# Altium schematic sheet AltiumST32_Schematic.SchDoc
size A3; SheetNumber: 1; SheetTotal: 1
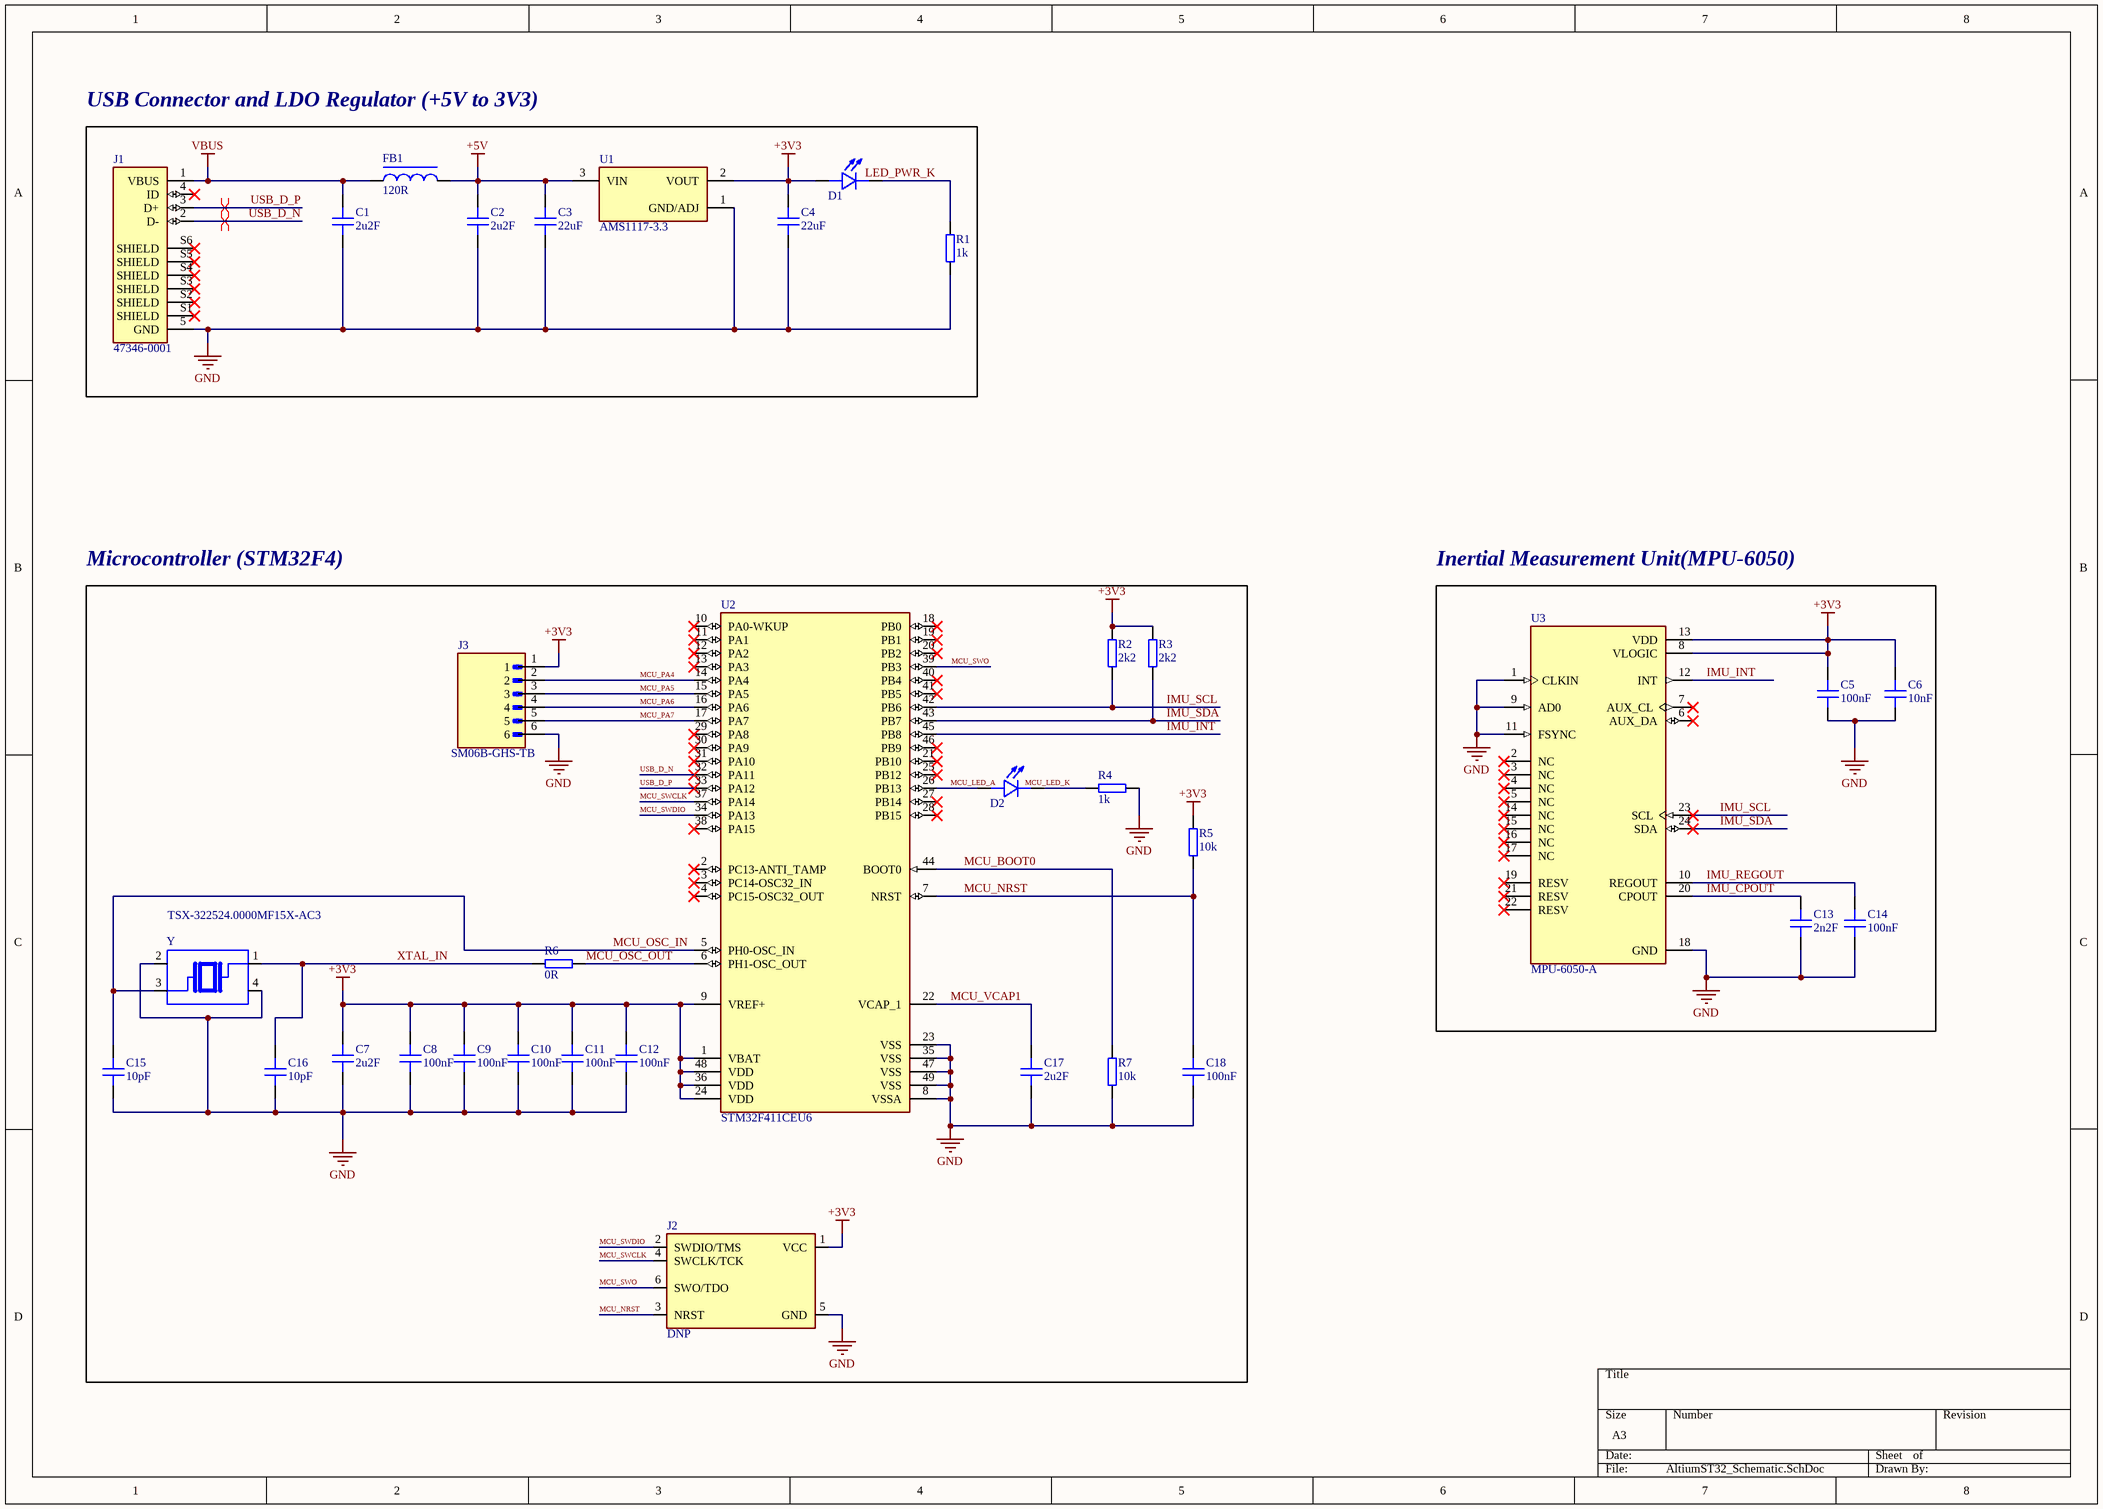
[diagram p0: AltiumST32_Schematic.SchDoc]

## Parts
C1  2u2F  [C0603]
C2  2u2F  [C0603]
C3  22uF  [C0805]
C4  22uF  [C0805]
C5  100nF  [C0402]
C6  10nF  [C0402]
C7  2u2F  [C0603]
C8  100nF  [C0402]
C9  100nF  [C0402]
C10  100nF  [C0402]
C11  100nF  [C0402]
C12  100nF  [C0402]
C13  2n2F  [C0402]
C14  100nF  [C0402]
C15  10pF  [C0402]
C16  10pF  [C0402]
C17  2u2F  [C0603]
C18  100nF  [C0402]
D1  SML-P11VTT86R  [LED_SML-P11VTT86R]  (value not drawn)
D2  SML-P11VTT86R  [LED_SML-P11VTT86R]  (value not drawn)
FB1  120R  [WE-CBF_0603_W2.6]
J1  47346-0001  [MOLEX_47346-0001]
J2  DNP  [TAG_TC2030-IDC-NL]
J3  SM06B-GHS-TB  [JST_SM06B-GHS-TB]
R1  1k  [R0402_1005]
R2  2k2  [R0402_1005]
R3  2k2  [R0402_1005]
R4  1k  [R0402_1005]
R5  10k  [R0402_1005]
R6  0R  [R0402_1005]
R7  10k  [R0402_1005]
U1  AMS1117-3.3  [SOT229P700X180-4N]
U2  STM32F411CEU6  [QFN50P700X700X60-49N]
U3  MPU-6050-A  [QFN50P400X400X95-24N]
Y  TSX-322524.0000MF15X-AC3  [OSCCC320X250X60]

## Blocks framed on the sheet
USB Connector and LDO Regulator (+5V to 3V3): C1-C4 D1 FB1 J1 R1 U1
Microcontroller (STM32F4): C7-C12 C15-C18 D2 J2 J3 R2-R7 U2 Y
Inertial Measurement Unit(MPU-6050): C5 C6 C13 C14 U3

## Nets
+3V3: C4.2 C5.1 C6.1 C7.2 C8.2 C9.2 C10.2 C11.2 C12.2 D1.A J2.1(VCC) J3.1 R2.2 R3.2 R5.2 U1.2(VOUT) U2.1(VBAT) U2.9(VREF+) U2.24(VDD) U2.36(VDD) U2.48(VDD) U3.8(VLOGIC) U3.13(VDD)
+5V: C2.2 C3.2 FB1.2 U1.3(VIN)
GND: C1.1 C2.1 C3.1 C4.1 C5.2 C6.2 C7.1 C8.1 C9.1 C10.1 C11.1 C12.1 C13.1 C14.1 C15.1 C16.1 C17.1 C18.1 J1.5(GND) J2.5(GND) J3.6 R1.1 R4.1 R7.1 U1.1(GND/ADJ) U2.8(VSSA) U2.23(VSS) U2.35(VSS) U2.47(VSS) U2.49(VSS) U3.1(CLKIN) U3.9(AD0) U3.11(FSYNC) U3.18(GND) Y.2 Y.4
VBUS: C1.2 FB1.1 J1.1(VBUS)
IMU_CPOUT: C13.2 U3.20(CPOUT)
IMU_INT: U2.45(PB8) U3.12(INT)
IMU_REGOUT: C14.2 U3.10(REGOUT)
IMU_SCL: R2.1 U2.42(PB6) U3.23(SCL)
IMU_SDA: R3.1 U2.43(PB7) U3.24(SDA)
LED_PWR_K: D1.K R1.2
MCU_BOOT0: R7.2 U2.44(BOOT0)
MCU_LED_A: D2.A U2.26(PB13)
MCU_LED_K: D2.K R4.2
MCU_NRST: C18.2 J2.3(NRST) R5.1 U2.7(NRST)
MCU_OSC_IN: C15.2 U2.5(PH0-OSC_IN) Y.3
MCU_OSC_OUT: R6.2 U2.6(PH1-OSC_OUT)
MCU_PA4: J3.2 U2.14(PA4)
MCU_PA5: J3.3 U2.15(PA5)
MCU_PA6: J3.4 U2.16(PA6)
MCU_PA7: J3.5 U2.17(PA7)
MCU_SWCLK: J2.4(SWCLK/TCK) U2.37(PA14)
MCU_SWDIO: J2.2(SWDIO/TMS) U2.34(PA13)
MCU_SWO: J2.6(SWO/TDO) U2.39(PB3)
MCU_VCAP1: C17.2 U2.22(VCAP_1)
USB_D_N: J1.2(D-) U2.32(PA11)
USB_D_P: J1.3(D+) U2.33(PA12)
XTAL_IN: C16.2 R6.1 Y.1

Not connected (* = marked no-connect by the designer): J1 4(ID)* S1(SHIELD)* S2(SHIELD)* S3(SHIELD)* S4(SHIELD)* S5(SHIELD)* S6(SHIELD)*; U2 2(PC13-ANTI_TAMP)* 3(PC14-OSC32_IN)* 4(PC15-OSC32_OUT)* 10(PA0-WKUP)* 11(PA1)* 12(PA2)* 13(PA3)* 18(PB0)* 19(PB1)* 20(PB2)* 21(PB10)* 25(PB12)* 27(PB14)* 28(PB15)* 29(PA8)* 30(PA9)* 31(PA10)* 38(PA15)* 40(PB4)* 41(PB5)* 46(PB9)*; U3 2(NC)* 3(NC)* 4(NC)* 5(NC)* 6(AUX_DA)* 7(AUX_CL)* 14(NC)* 15(NC)* 16(NC)* 17(NC)* 19(RESV)* 21(RESV)* 22(RESV)*

## Layout directives
differential pair; net class DIFF_USB: USB_D_N, USB_D_P

## Library data of the parts
C1 C2 C7 C17 = CAP_0603_10V: SMD Capacitor; Voltage: 10V; Designator: ?; Value: 2u2F; Dielectric: ?; Manufacturer Reference: ?; Package: =Footprint; Tolerance: ?; Power: ?; Excepted: ?
C3 C4 = CAP_0805_16V: SMD Capacitor; Voltage: 16V; Designator: ?; Value: 22uF; Dielectric: ?; Manufacturer Reference: ?; Package: =Footprint; Tolerance: ?; Power: ?; Excepted: ?
C5 C6 C8-C14 C18 = CAP_0402_10V: SMD Capacitor; Voltage: 10V; Tolerance: 10%; Designator: ?; Dielectric: ?; Manufacturer Reference: ?; Package: =Footprint; Power: ?; Excepted: ?
  C5 C8-C12 C14 C18: Value: 100nF
  C6: Value: 10nF
  C13: Value: 2n2F
C15 C16 = CAP_0402_16V: SMD Capacitor; Voltage: 16V; Designator: ?; Value: 10pF; Dielectric: ?; Manufacturer Reference: ?; Package: =Footprint; Tolerance: ?; Power: ?; Excepted: ?
D1 D2 = SML-P11VTT86R: Red 626nm LED Indication SMD - Discrete 1.8V 0402 (1006 Metric); MF: Rohm; Purchase-URL: https://pricing.snapeda.com/search?q=SML-P11VTT86R&ref=eda; Package: 0402 Rohm; Check_prices: https://www.snapeda.com/parts/SML-P11VTT86R/Rohm/view-part/?ref=eda; Value: *; SnapEDA_Link: https://www.snapeda.com/parts/SML-P11VTT86R/Rohm/view-part/?ref=snap; MP: SML-P11VTT86R; Digi-Key_Part_Number: 846-SML-P11VTT86RTR-ND
FB1 = 742792625: Multilayer Chip Ferrite Bead 0603 120R 2A ¦ Wurth Electronics 742792625; MF: WÃ¼rth Elektronik; SnapEDA_Link: https://www.snapeda.com/parts/742792625/W%25C3%25BCrth+Elektronik+Midcom/view-part/?ref=snap; Package: 0603 Wurth Elektronik; Value: 120R; MP: 742792625; Check_prices: https://www.snapeda.com/parts/742792625/W%25C3%25BCrth+Elektronik+Midcom/view-part/?ref=eda
J1 = 47346-0001: Conn Data USB Micro B w/Flange SMT Bottom Mnt LF | Molex Incorporated 47346-0001; SnapEDA_Link: https://www.snapeda.com/parts/47346-0001/Molex/view-part/?ref=snap; Package: None; Value: *; MF: Molex; MP: 47346-0001; Check_prices: https://www.snapeda.com/parts/47346-0001/Molex/view-part/?ref=eda
J2 = TC2030-NL: Tag connect , CABLE ADAPTER 6 POS; MP: TC2030-IDC-NL; Value: *; Availability: Unavailable; Package: None; Price: None
J3 = SM06B-GHS-TB: Connector Header Surface Mount, Right Angle 6 position 0.049 (1.25mm); MF: JST Sales; SnapEDA_Link: https://www.snapeda.com/parts/SM06B-GHS-TB/JST/view-part/?ref=snap; Package: None; Value: *; MP: SM06B-GHS-TB; Check_prices: https://www.snapeda.com/parts/SM06B-GHS-TB/JST/view-part/?ref=eda
R1-R7 = Resistor: SMD Resistor; Designator: ?; Voltage: ?; Dielectric: ?; Manufacturer Reference: ?; Package: ?; Tolerence: ?; Power: ?; Excepted: ?
  R1 R4: Value: 1k
  R2 R3: Value: 2k2
  R5 R7: Value: 10k
  R6: Value: 0R
U1 = AMS1117-3.3: Sot223/Pkg 1-Amp 3.3-Volt Low Drop Out Voltage Regulatator; MF: Advanced Monolithic Systems; SnapEDA_Link: https://www.snapeda.com/parts/AMS1117-3.3/Advanced+Monolithic+Systems/view-part/?ref=snap; Package: SOT-223 Seeed Technology; Value: *; MP: AMS1117-3.3; Check_prices: https://www.snapeda.com/parts/AMS1117-3.3/Advanced+Monolithic+Systems/view-part/?ref=eda
U2 = STM32F411CEU6: High-performance access line, ARM Cortex-M4 core with DSP and FPU, 512 Kbytes Flash, 100 MHz CPU, ART Accelerator; Package: None; Availability: Unavailable; Value: *; MP: STM32F411CEU6; Price: None
U3 = MPU-6050-A: MF: TDK InvenSense; SnapEDA_Link: https://www.snapeda.com/parts/MPU-6050-A/InvenSense/view-part/?ref=snap; Package: None; Value: *; MP: MPU-6050-A; Check_prices: https://www.snapeda.com/parts/MPU-6050-A/InvenSense/view-part/?ref=eda
Y = TSX-322524.0000MF15X-AC3: 24MHz Â±10ppm Crystal 9pF 40 Ohms 4-SMD, No Lead; MF: EPSON; Availability: Unavailable; Value: *; Package: SMD-4 EPSON; Price: None; SnapEDA_Link: https://www.snapeda.com/parts/TSX-3225%2024.0000MF15X-AC3/EPSON/view-part/230042/?ref=snap; MP: TSX-3225 24.0000MF15X-AC3